# Altium schematic sheet DRV+Motor.SchDoc
size A4; SheetNumber: 5; SheetTotal: 9
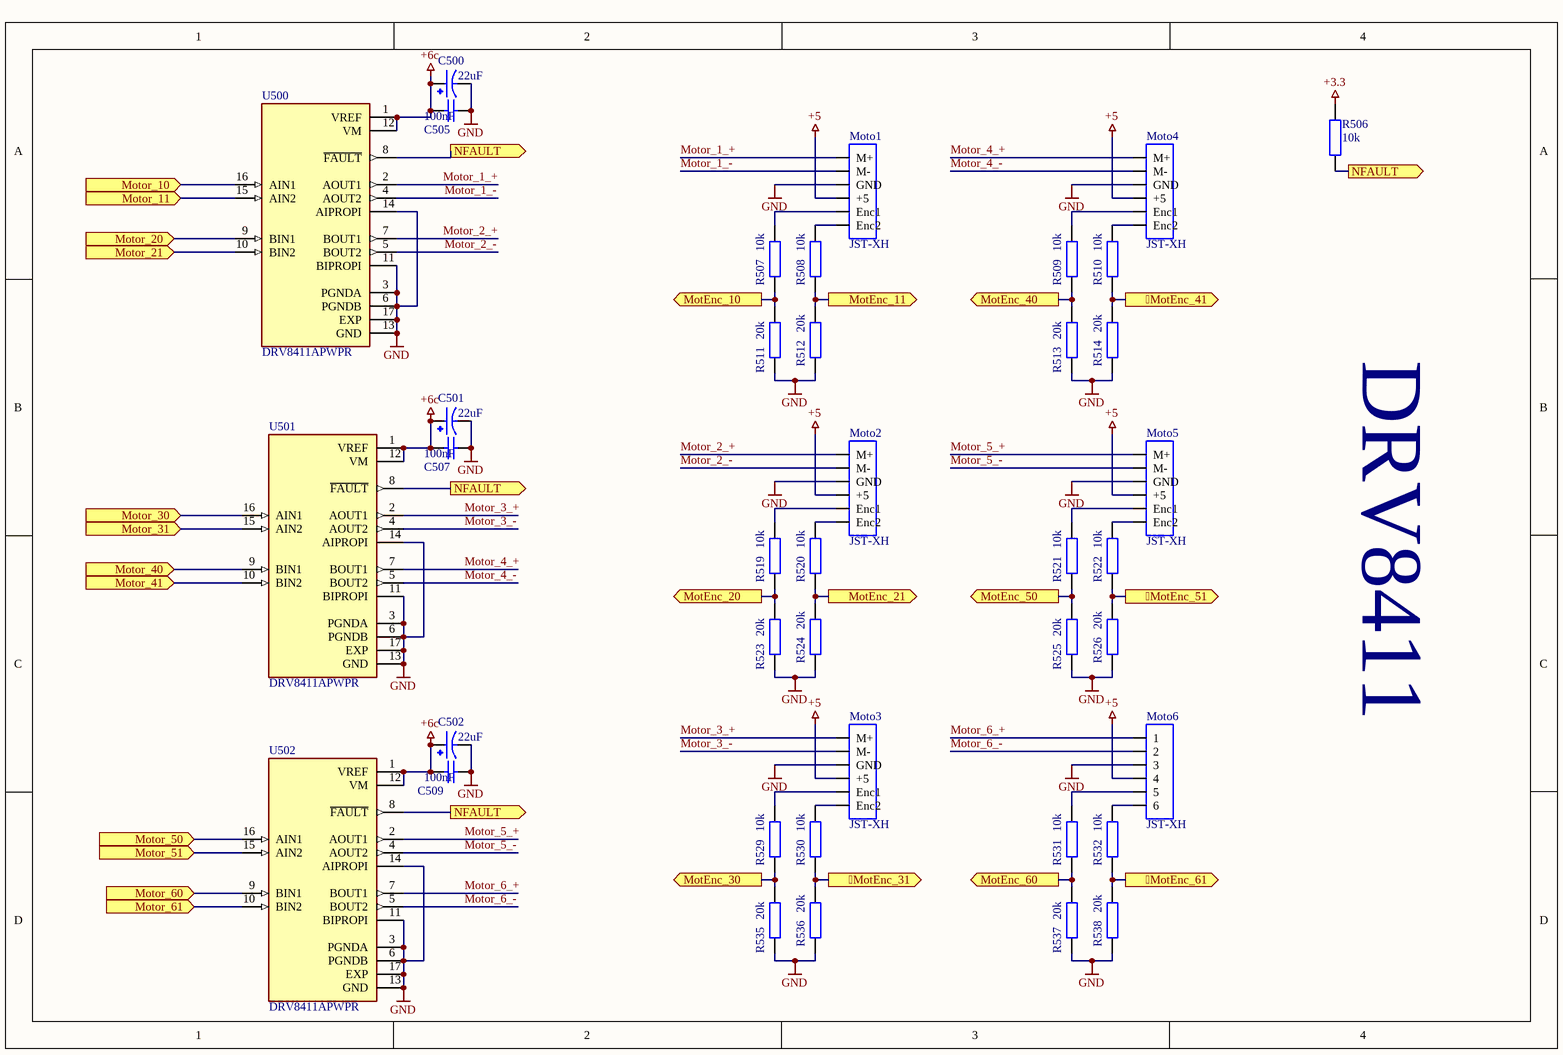
[diagram p0: DRV+Motor.SchDoc]

## Parts
C500  value 22uF  [CAP_EEEFN1A220R]  (hidden comment: ELKO)
C501  value 22uF  [CAP_EEEFN1A220R]  (hidden comment: ELKO)
C502  value 22uF  [CAP_EEEFN1A220R]  (hidden comment: ELKO)
C505  value 100nF  [0603]  (hidden comment: 0603)
C507  value 100nF  [0603]  (hidden comment: 0603)
C509  value 100nF  [0603]  (hidden comment: 0603)
Moto1  JST-XH  [SIP-6]
Moto2  JST-XH  [SIP-6]
Moto3  JST-XH  [SIP-6]
Moto4  JST-XH  [SIP-6]
Moto5  JST-XH  [SIP-6]
Moto6  JST-XH  [SIP-6]
R506  value 10k  [0603]  (hidden comment: 0603)
R507  value 10k  [0603]  (hidden comment: 0603)
R508  value 10k  [0603]  (hidden comment: 0603)
R509  value 10k  [0603]  (hidden comment: 0603)
R510  value 10k  [0603]  (hidden comment: 0603)
R511  value 20k  [0603]  (hidden comment: 0603)
R512  value 20k  [0603]  (hidden comment: 0603)
R513  value 20k  [0603]  (hidden comment: 0603)
R514  value 20k  [0603]  (hidden comment: 0603)
R519  value 10k  [0603]  (hidden comment: 0603)
R520  value 10k  [0603]  (hidden comment: 0603)
R521  value 10k  [0603]  (hidden comment: 0603)
R522  value 10k  [0603]  (hidden comment: 0603)
R523  value 20k  [0603]  (hidden comment: 0603)
R524  value 20k  [0603]  (hidden comment: 0603)
R525  value 20k  [0603]  (hidden comment: 0603)
R526  value 20k  [0603]  (hidden comment: 0603)
R529  value 10k  [0603]  (hidden comment: 0603)
R530  value 10k  [0603]  (hidden comment: 0603)
R531  value 10k  [0603]  (hidden comment: 0603)
R532  value 10k  [0603]  (hidden comment: 0603)
R535  value 20k  [0603]  (hidden comment: 0603)
R536  value 20k  [0603]  (hidden comment: 0603)
R537  value 20k  [0603]  (hidden comment: 0603)
R538  value 20k  [0603]  (hidden comment: 0603)
U500  DRV8411APWPR  [IC_DRV8411APWPR]
U501  DRV8411APWPR  [IC_DRV8411APWPR]
U502  DRV8411APWPR  [IC_DRV8411APWPR]

## Ports
MotEnc_31 (out, see STM32[1C]), MotEnc_41 (out, see STM32[1C]), MotEnc_51 (out, see STM32[2C]), MotEnc_61 (out, see STM32[2B]), MotEnc_10 (out, see STM32[2B]), MotEnc_11 (out, see STM32[2B]), MotEnc_20 (out, see STM32[2B]), MotEnc_21 (out, see STM32[1C]), MotEnc_30 (out, see STM32[1C]), MotEnc_40 (out, see STM32[1C]), MotEnc_50 (out, see STM32[2B]), MotEnc_60 (out, see STM32[2B]), Motor_10 (in, see STM32[1C]), Motor_11 (in, see STM32[1B]), Motor_20 (in, see STM32[1B]), Motor_21 (in, see STM32[1B]), Motor_30 (in, see STM32[1B]), Motor_31 (in, see STM32[2B]), Motor_40 (in, see STM32[2B]), Motor_41 (in, see STM32[2B]), Motor_50 (in, see STM32[2B]), Motor_51 (in, see STM32[1B]), Motor_60 (in, see STM32[1B]), Motor_61 (in, see STM32[1B]), NFAULT (out, see DRV+Motor[2A], DRV+Motor[2B], DRV+Motor[2D], STM32[1C]), NFAULT (out, see DRV+Motor[2A], DRV+Motor[2B], DRV+Motor[4A], STM32[1C]), NFAULT (out, see DRV+Motor[2A], DRV+Motor[2D], DRV+Motor[4A], STM32[1C]), NFAULT (out, see DRV+Motor[2B], DRV+Motor[2D], DRV+Motor[4A], STM32[1C])

## Nets
+3.3: R506.2
+5: Moto1.4(+5) Moto2.4(+5) Moto3.4(+5) Moto4.4(+5) Moto5.4(+5) Moto6.4
+6c: C500.1 C501.1 C502.1 C505.2 C507.2 C509.2 U500.1(VREF) U500.12(VM) U501.1(VREF) U501.12(VM) U502.1(VREF) U502.12(VM)
GND: C500.2 C501.2 C502.2 C505.1 C507.1 C509.1 Moto1.3(GND) Moto2.3(GND) Moto3.3(GND) Moto4.3(GND) Moto5.3(GND) Moto6.3 R511.1 R512.1 R513.1 R514.1 R523.1 R524.1 R525.1 R526.1 R535.1 R536.1 R537.1 R538.1 U500.3(PGNDA) U500.6(PGNDB) U500.11(BIPROPI) U500.13(GND) U500.14(AIPROPI) U500.17(EXP) U501.3(PGNDA) U501.6(PGNDB) U501.11(BIPROPI) U501.13(GND) U501.14(AIPROPI) U501.17(EXP) U502.3(PGNDA) U502.6(PGNDB) U502.11(BIPROPI) U502.13(GND) U502.14(AIPROPI) U502.17(EXP)
MotEnc_31: R530.2 R536.2 ; port MotEnc_31
MotEnc_41: R510.2 R514.2 ; port MotEnc_41
MotEnc_51: R522.2 R526.2 ; port MotEnc_51
MotEnc_61: R532.2 R538.2 ; port MotEnc_61
MotEnc_10: R507.2 R511.2 ; port MotEnc_10
MotEnc_11: R508.2 R512.2 ; port MotEnc_11
MotEnc_20: R519.2 R523.2 ; port MotEnc_20
MotEnc_21: R520.2 R524.2 ; port MotEnc_21
MotEnc_30: R529.2 R535.2 ; port MotEnc_30
MotEnc_40: R509.2 R513.2 ; port MotEnc_40
MotEnc_50: R521.2 R525.2 ; port MotEnc_50
MotEnc_60: R531.2 R537.2 ; port MotEnc_60
Motor_1_+: Moto1.1(M+) U500.2(AOUT1)
Motor_1_-: Moto1.2(M-) U500.4(AOUT2)
Motor_2_+: Moto2.1(M+) U500.7(BOUT1)
Motor_2_-: Moto2.2(M-) U500.5(BOUT2)
Motor_3_+: Moto3.1(M+) U501.2(AOUT1)
Motor_3_-: Moto3.2(M-) U501.4(AOUT2)
Motor_4_+: Moto4.1(M+) U501.7(BOUT1)
Motor_4_-: Moto4.2(M-) U501.5(BOUT2)
Motor_5_+: Moto5.1(M+) U502.2(AOUT1)
Motor_5_-: Moto5.2(M-) U502.4(AOUT2)
Motor_6_+: Moto6.1 U502.7(BOUT1)
Motor_6_-: Moto6.2 U502.5(BOUT2)
Motor_10: U500.16(AIN1) ; port Motor_10
Motor_11: U500.15(AIN2) ; port Motor_11
Motor_20: U500.9(BIN1) ; port Motor_20
Motor_21: U500.10(BIN2) ; port Motor_21
Motor_30: U501.16(AIN1) ; port Motor_30
Motor_31: U501.15(AIN2) ; port Motor_31
Motor_40: U501.9(BIN1) ; port Motor_40
Motor_41: U501.10(BIN2) ; port Motor_41
Motor_50: U502.16(AIN1) ; port Motor_50
Motor_51: U502.15(AIN2) ; port Motor_51
Motor_60: U502.9(BIN1) ; port Motor_60
Motor_61: U502.10(BIN2) ; port Motor_61
NFAULT: R506.1 U500.8(~{FAULT}) U501.8(~{FAULT}) U502.8(~{FAULT}) ; port NFAULT
NetMoto1_5: Moto1.5(Enc1) R507.1
NetMoto1_6: Moto1.6(Enc2) R508.1
NetMoto2_5: Moto2.5(Enc1) R519.1
NetMoto2_6: Moto2.6(Enc2) R520.1
NetMoto3_5: Moto3.5(Enc1) R529.1
NetMoto3_6: Moto3.6(Enc2) R530.1
NetMoto4_5: Moto4.5(Enc1) R509.1
NetMoto4_6: Moto4.6(Enc2) R510.1
NetMoto5_5: Moto5.5(Enc1) R521.1
NetMoto5_6: Moto5.6(Enc2) R522.1
NetMoto6_5: Moto6.5 R531.1
NetMoto6_6: Moto6.6 R532.1

## Notes on the sheet
- DRV8411

## Library data of the parts
C500-C502 = EEEFN1A220R: CAP ALUM 22UF 20% 10V SMD; MF: Panasonic; SnapEDA_Link: https://www.snapeda.com/parts/EEEFN1A220R/Panasonic/view-part/?ref=snap; Availability: In Stock; Purchase-URL: https://pricing.snapeda.com/search/part/EEEFN1A220R/?ref=eda; MP: EEEFN1A220R; Price: None; Package: RADIAL-2 Panasonic; Check_prices: https://www.snapeda.com/parts/EEEFN1A220R/Panasonic/view-part/?ref=eda
C505 C507 C509 = KO: Kondensator
Moto1-Moto6 = CON6
R506-R514 R519-R526 R529-R532 R535-R538 = RES: Widerstand
U500-U502 = DRV8411APWPR: 1.65-V to 11-V, 4-A dual H-bridge motor driver with IPROPI current regulation; MF: Texas Instruments; SnapEDA_Link: https://www.snapeda.com/parts/DRV8411APWPR/Texas+Instruments/view-part/?ref=snap; Package: TSSOP-16 Texas Instruments; Value: *; MP: DRV8411APWPR; Check_prices: https://www.snapeda.com/parts/DRV8411APWPR/Texas+Instruments/view-part/?ref=eda